# Altium schematic sheet Sheet.SchDoc
size A4; SheetNumber: 1; SheetTotal: 2
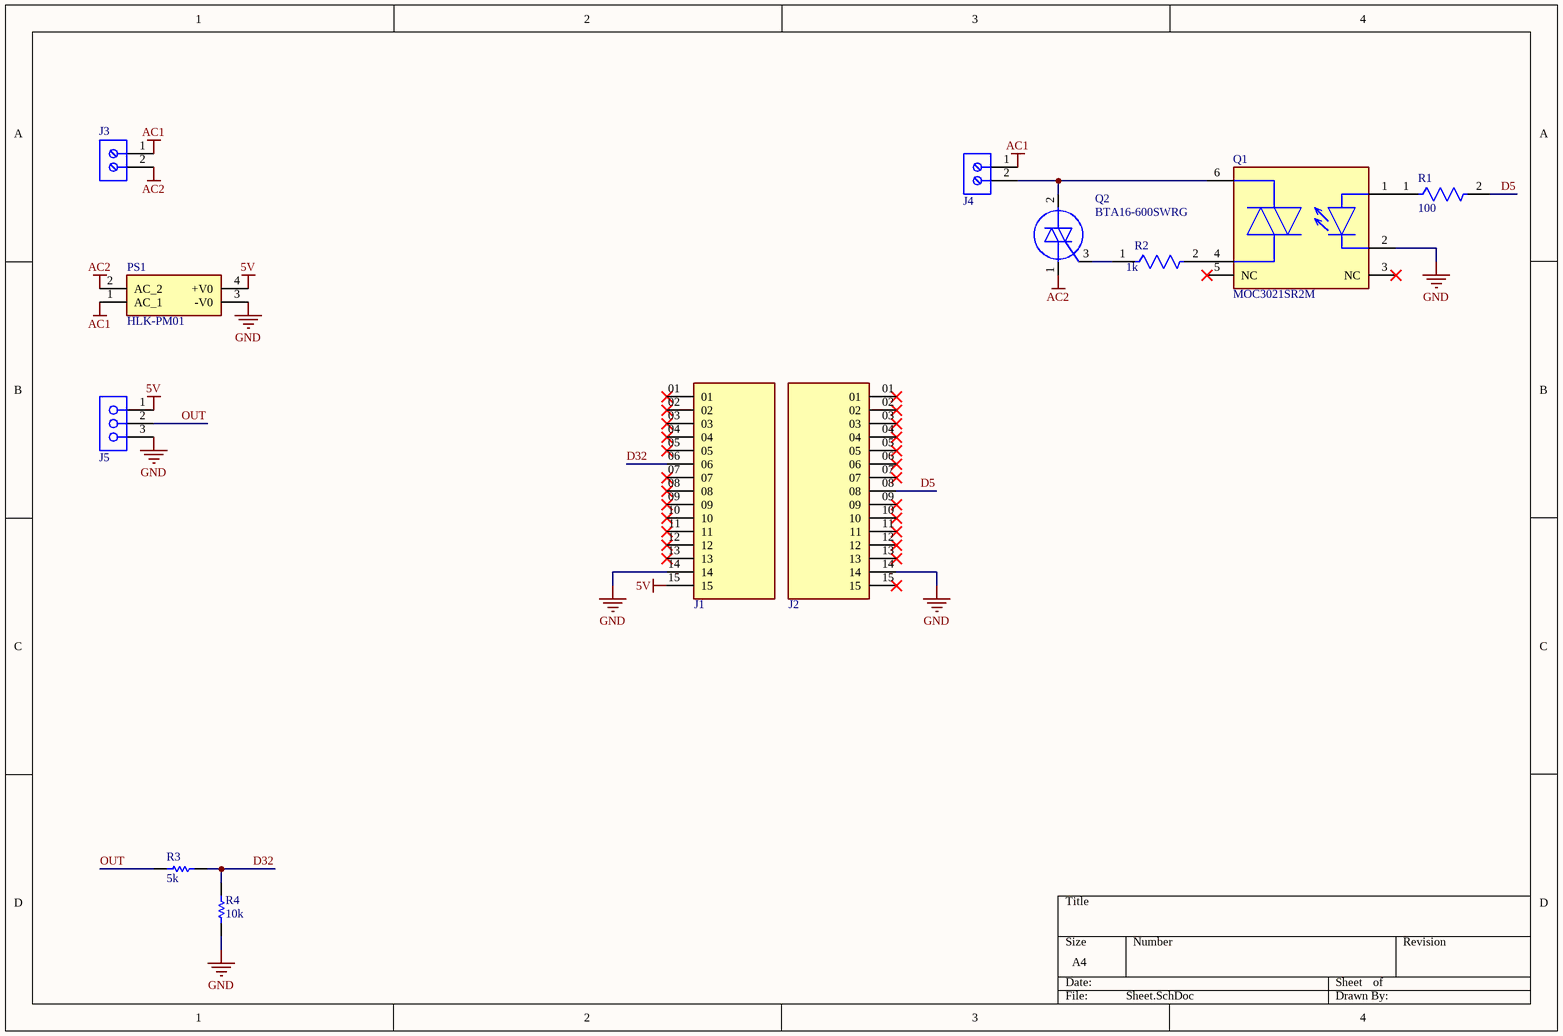
[diagram p0: Sheet.SchDoc]

## Parts
J1  BCS-115-L-S-TE  [SAMTEC_BCS-115-L-S-TE]  (value not drawn)
J2  BCS-115-L-S-TE  [SAMTEC_BCS-115-L-S-TE]  (value not drawn)
J3  691214110002  [691214110002]  (value not drawn)
J4  691214110002  [691214110002]  (value not drawn)
J5  BCS-103-F-S-TE  [SMTC-BCS-103-X-S-TE]  (value not drawn)
PS1  HLK-PM01  [HLKPM01]
Q1  MOC3021SR2M  [FP-646BY-MFG]
Q2  BTA16-600SWRG  [TO255P460X1020X2005-3P]
R1  100  [FP-RC0603-0_55-MFG]
R2  1k  [FP-CRCW2512-e3-IPC_C]
R3  5k  [RESC2013X50X30ML20T20]
R4  10k  [RESC3116X65X50NL20T20]

## Nets
5V: J1.15 J5.1 PS1.4(+V0)
AC1: J3.1 J4.1 PS1.1(AC_1)
AC2: J3.2 PS1.2(AC_2) Q2.1(A1)
GND: J1.14 J2.14 J5.3 PS1.3(-V0) Q1.2(C) R4.1
D5: J2.08 R1.2
D32: J1.06 R3.2 R4.2
OUT: J5.2 R3.1
NetJ4_2: J4.2 Q1.6(2_MAIN_TERM.) Q2.2(A2)
NetQ1_1: Q1.1(A) R1.1
NetQ1_4: Q1.4(1_MAIN_TERM.) R2.2
NetQ2_3: Q2.3(G) R2.1

Not connected (* = marked no-connect by the designer): J1 01* 02* 03* 04* 05* 07* 08* 09* 10* 11* 12* 13*; J2 01* 02* 03* 04* 05* 06* 07* 09* 10* 11* 12* 13* 15*; Q1 3(NC)* 5(NC)*

## Library data of the parts
J1 J2 = CMP-002-00071-2: 15 Position Receptacle Connector 0.100 (2.54mm) Through Hole Gold; MF: Samtec Inc.; Source: BCS-115-L-S-TE.SchLib; Check_prices: https://www.snapeda.com/parts/BCS-115-L-S-TE/Samtec+Inc./view-part/?ref=eda; Digi-Key_Part_Number: SAM1011-15-ND; Design Item ID: BCS-115-L-S-TE; Purchase-URL: https://pricing.snapeda.com/search/part/BCS-115-L-S-TE/?ref=eda; Value: *; Component Type: Standard; Case/Package: None; Pins: 15; MP: BCS-115-L-S-TE; SnapEDA_Link: https://www.snapeda.com/parts/BCS-115-L-S-TE/Samtec+Inc./view-part/?ref=snap
J3 J4 = CMP-1502-02464-2: Terminal Block; NexarPartId: 18818288; Plating: Brass, Steel; Current: 10A; Pitch: 3.5052mm; Number of Levels: 1; Number of Contacts: 2; Wire Gauge (Min): 16AWG; Voltage: 300V; Wire Gauge (Max): 24AWG; Stripping Length: -6mm; Number of Pins: 2; Number of Rows: 1; REACH SVHC: Unknown; RoHS: Compliant; Housing Material: Nylon; Termination: Screw; Mount: Through Hole; Contact Plating: Brass, Tin; Number of Positions Per Level: 2; Color: Blue, Green; Width: 7.9mm; Voltage Rating: 300V; Length: 7.4mm; Current Rating: 10A; Wire/Cable Gauge: 24AWG; Packaging: Box; Max Operating Temperature: 105°C; Lead Pitch: 3.5mm; Height: 8.7mm; Contact Material: Brass; Min Operating Temperature: -40°C
J5 = CMP-1023-00006-1: Tiger Claw(TM) Pass-Through Socket, Vertical, -55 to 125 degC, 2.54 mm Pitch, 3-Pin, Female, RoHS; Manufacturer: Samtec; Pitch: 2.54 mm; DatasheetVersion: F-214; Orientation: Vertical; PartNumber: BCS-103-F-S-TE; ComponentLink2Description: Datasheet; ComponentLink3Description: Package Specification; ComponentLink1Description: Manufacturer URL; ComponentLink1URL: http://www.samtec.com; ComponentLink3URL: http://www.samtec.com/documents/webfiles/cpdf/BCS-1XX-XXX-X-XX-XXX-MKT.pdf; Temperature Range: -55 to 125 degC; RoHS: True; PackageReference: BCS-103-X-S-TE; PackageVersion: BV, 9/1991; ComponentLink2URL: http://www.samtec.com/documents/webfiles/pdf/BCS.PDF; PackageDescription: Box Connector Socket Strip; Mounting Technology: Through-hole
PS1 = HLK-PM01: Power Supply; Manufacturer_Name: Hi-Link; Datasheet Link: https://datasheet.lcsc.com/szlcsc/1906201102_HI-LINK-HLK-PM03_C209904.pdf; Height: 15mm; Manufacturer_Part_Number: HLK-PM01
Q1 = CMP-00278-84330365-1: MOC3021SR2M Triac Driver Output Optocoupler, 6-Pin DIP 400V Random Phase; Manufacturer Lifecycle Status: ACTIVE; Number of Channels: 1; Reverse Breakdown Voltage: 3V; Max Input Current: 60mA; Forward Voltage: 1.15V; Max Power Dissipation: 330mW; Max Input Voltage: 1.5V; Approvals: UL; Isolation Voltage: 5.3kV; Hold Current: 100µA; RoHS: Compliant; Case/Package: SMD/SMT; Number of Elements: 1; Input Current: 60mA; Forward Current: 60mA; Output Voltage: 400V; Schedule B: 8541408000, 8541408000; REACH SVHC: No SVHC; Number of Pins: 6; Max Operating Temperature: 85°C; Weight: 810mg; Power Dissipation: 330mW; Mount: Surface Mount; Lead Free: Lead Free; Nominal Input Voltage: 1.15V; Radiation Hardening: No; Lifecycle Status: Production; NexarPartId: 84330365; Number of Circuits: 1; Min Operating Temperature: -40°C
Q2 = BTA16-600SWRG: Triac A; Manufacturer_Name: STMicroelectronics; Datasheet Link: http://www.st.com/web/en/resource/technical/document/datasheet/CD00002265.pdf; Height: 4.6mm; Manufacturer_Part_Number: BTA16-600SWRG; Mouser Part Number: 511-BTA16-600SW; Mouser Price/Stock: https://www.mouser.co.uk/ProductDetail/STMicroelectronics/BTA16-600SWRG?qs=zgJYeb29rD7irNzaclX92Q%3D%3D; Arrow Part Number: BTA16-600SWRG; Arrow Price/Stock: https://www.arrow.com/en/products/bta16-600swrg/stmicroelectronics?utm_currency=USD&region=europe
R1 = CMP-2100-03663-2: NexarPartId: 55402879; Voltage Rating: 50V; Power Rating: 100mW; Tolerance: 1%; Temperature Coefficient: 100ppm/°C; Resistance: 100Ω; Case/Package: 0603; Military Standard: Not; REACH SVHC: Unknown; Case Code (Metric): 0603; Max Operating Temperature: 155°C; Schedule B: 8533210045, 8533210045; Height: 450µm; Length: 1.6mm; Lead Free: Lead Free; Packaging: Tape & Reel; Case Code (Imperial): 0603; Composition: Thick Film; Min Operating Temperature: -55°C; Voltage Rating (DC): 50V; RoHS: Compliant; Depth: 800µm; Number of Pins: 2; Termination: SMD/SMT; Width: 800µm
R2 = CMP-02407-005880-1: RES Thick Film, 1kΩ, 1%, 1W, 100ppm/°C, 2512; Resistance: 1kR; Voltage Rating (DC): 500V; Case Code (Metric): 6432; Height: 0.6mm; Termination: SMD/SMT; Weight: 0.001429oz; Packaging: Tape and Reel; Composition: Thick Film; Number of Terminations: 2; Mount: Surface Mount; Max Operating Temperature: 155°C; Tolerance: 1%; Width: 3.15mm; Features: Automotive AEC-Q200; Contact Plating: Tin; Package Quantity: 10; Temperature Coefficient: 100ppm/°C; Lead Free: Lead Free; Power Rating: 1W; Min Operating Temperature: -55°C; Number of Pins: 2; Case/Package: 2512; Military Standard: Not; Max Power Dissipation: 1W; Length: 6.3mm; Depth: 3.15mm; Radiation Hardening: No; Case Code (Imperial): 2512; Voltage Rating: 500V
R3 = CMP-2001-04239-1: Part Number: CRCW08055K00FKTA; Manufacturer: Vishay Dale
R4 = CMP-2003-04883-1: Part Number: CRCW120610K0FKEAHP; Manufacturer: Vishay Dale